# Altium schematic sheet a0206-2006.7.SchDoc
size 558 x 431 mm
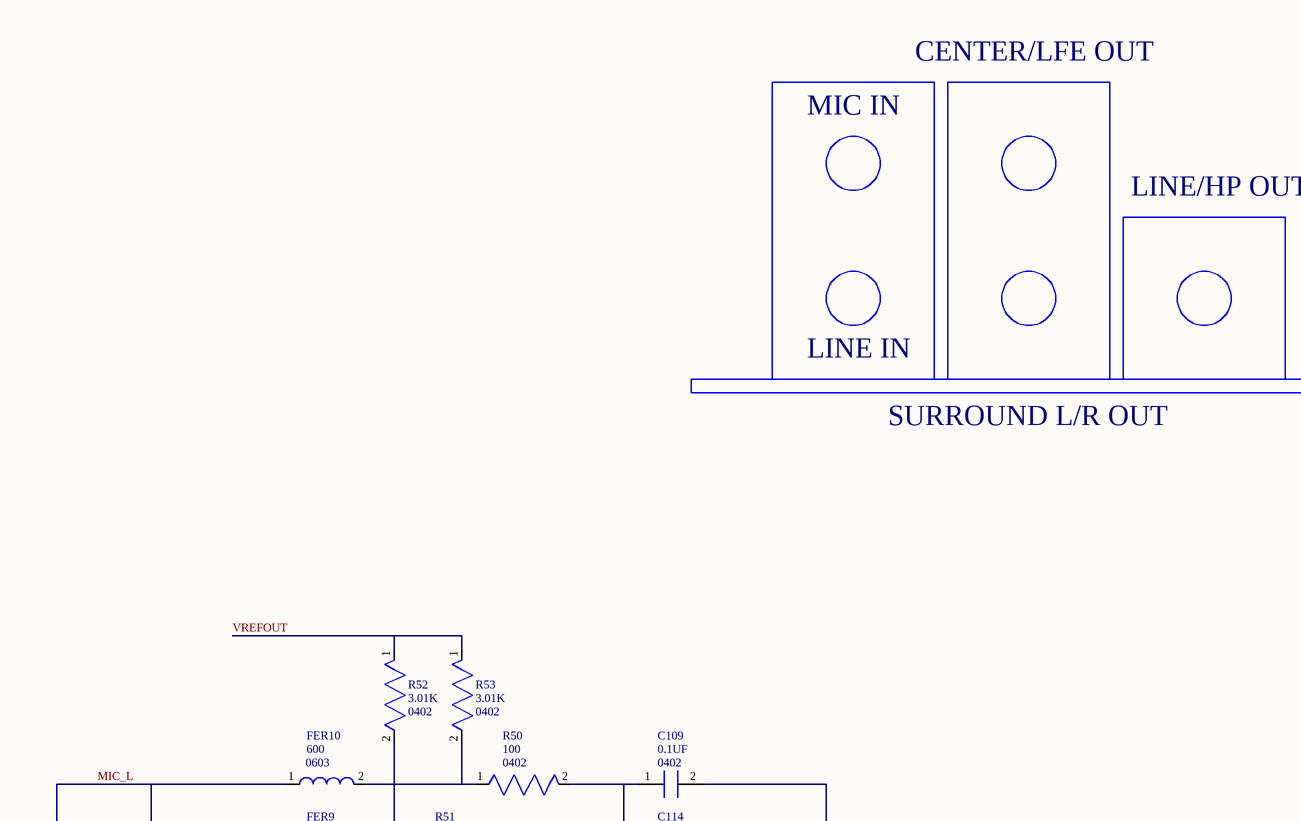
[diagram p0: a0206-2006.7.SchDoc, top left]
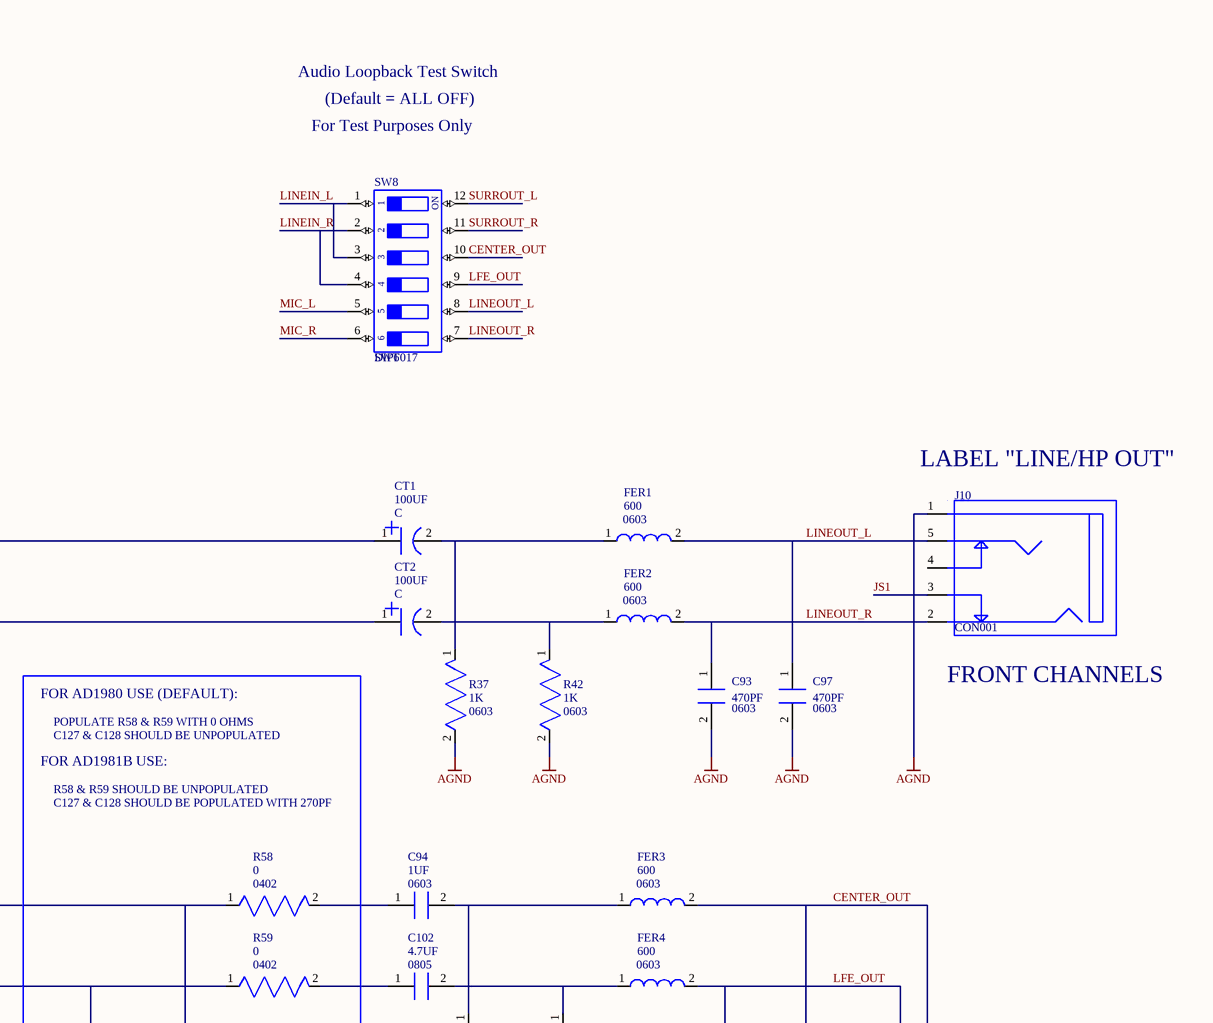
[diagram p1: a0206-2006.7.SchDoc, top right]
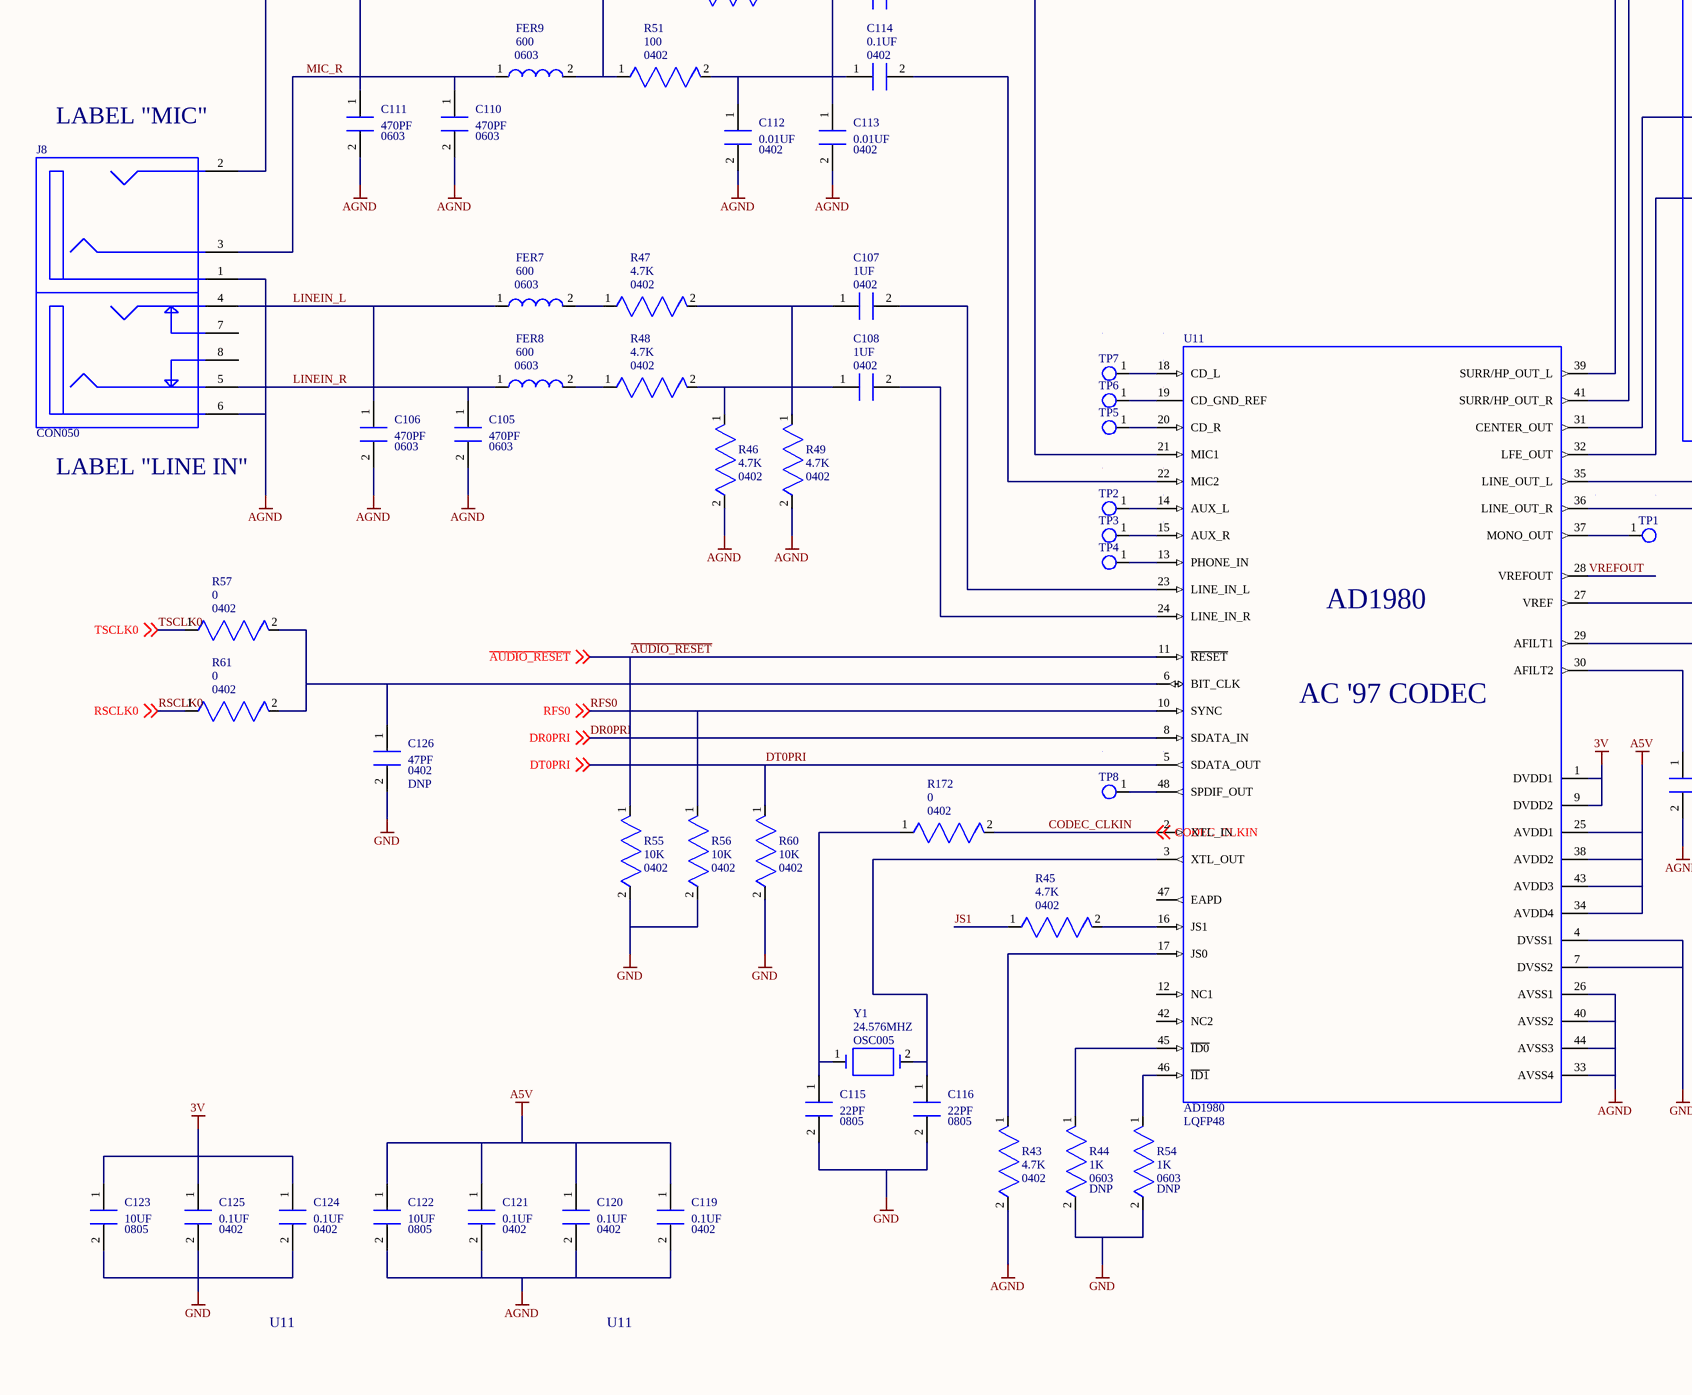
[diagram p2: a0206-2006.7.SchDoc, bottom left]
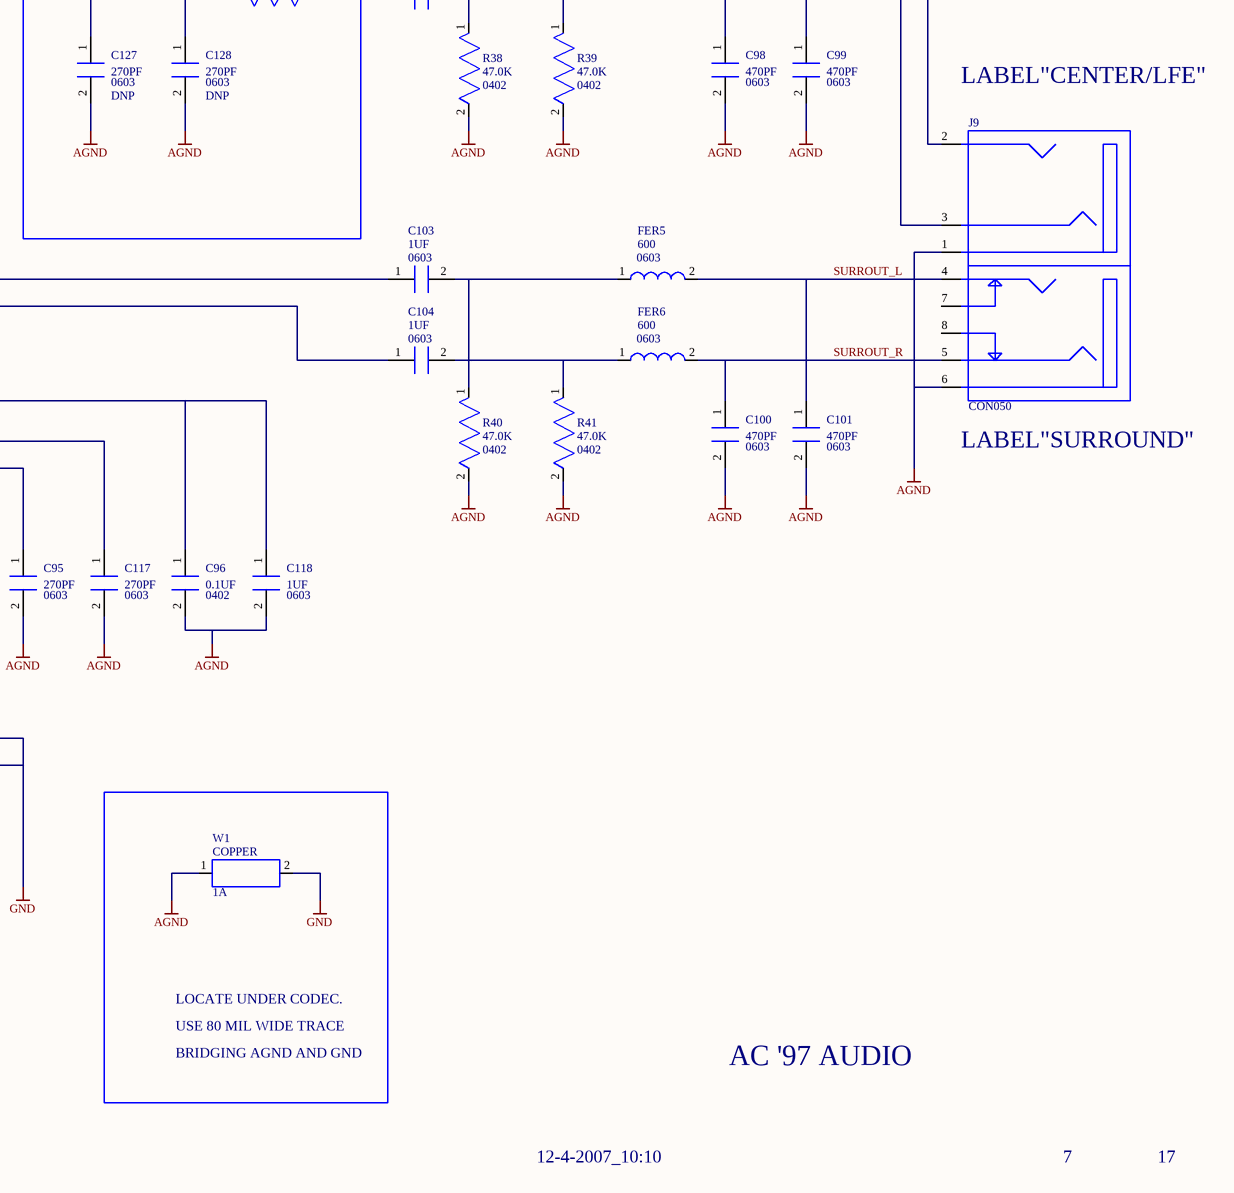
[diagram p3: a0206-2006.7.SchDoc, bottom right]

## Parts
C93  value 470PF  [0603]  (hidden comment: *)
C94  value 1UF  [0603]  (hidden comment: *)
C95  value 270PF  [0603]  (hidden comment: *)
C96  value 0.1UF  [0402]  (hidden comment: *)
C97  value 470PF  [0603]  (hidden comment: *)
C98  value 470PF  [0603]  (hidden comment: *)
C99  value 470PF  [0603]  (hidden comment: *)
C100  value 470PF  [0603]  (hidden comment: *)
C101  value 470PF  [0603]  (hidden comment: *)
C102  value 4.7UF  [0805]  (hidden comment: *)
C103  value 1UF  [0603]  (hidden comment: *)
C104  value 1UF  [0603]  (hidden comment: *)
C105  value 470PF  [0603]  (hidden comment: *)
C106  value 470PF  [0603]  (hidden comment: *)
C107  value 1UF  [0402]  (hidden comment: *)
C108  value 1UF  [0402]  (hidden comment: *)
C109  value 0.1UF  [0402]  (hidden comment: *)
C110  value 470PF  [0603]  (hidden comment: *)
C111  value 470PF  [0603]  (hidden comment: *)
C112  value 0.01UF  [0402]  (hidden comment: *)
C113  value 0.01UF  [0402]  (hidden comment: *)
C114  value 0.1UF  [0402]  (hidden comment: *)
C115  value 22PF  [0805]  (hidden comment: *)
C116  value 22PF  [0805]  (hidden comment: *)
C117  value 270PF  [0603]  (hidden comment: *)
C118  value 1UF  [0603]  (hidden comment: *)
C119  value 0.1UF  [0402]  (hidden comment: *)
C120  value 0.1UF  [0402]  (hidden comment: *)
C121  value 0.1UF  [0402]  (hidden comment: *)
C122  value 10UF  [0805]  (hidden comment: *)
C123  value 10UF  [0805]  (hidden comment: *)
C124  value 0.1UF  [0402]  (hidden comment: *)
C125  value 0.1UF  [0402]  (hidden comment: *)
C126  value 47PF  CLASS: DNP  [0402]  (hidden comment: *)
C127  value 270PF  CLASS: DNP  [0603]  (hidden comment: *)
C128  value 270PF  CLASS: DNP  [0603]  (hidden comment: *)
CT1  value 100UF  [C]  (hidden comment: *)
CT2  value 100UF  [C]  (hidden comment: *)
FER1  value 600  [0603]  (hidden comment: *)
FER2  value 600  [0603]  (hidden comment: *)
FER3  value 600  [0603]  (hidden comment: *)
FER4  value 600  [0603]  (hidden comment: *)
FER5  value 600  [0603]  (hidden comment: *)
FER6  value 600  [0603]  (hidden comment: *)
FER7  value 600  [0603]  (hidden comment: *)
FER8  value 600  [0603]  (hidden comment: *)
FER9  value 600  [0603]  (hidden comment: *)
FER10  value 600  [0603]  (hidden comment: *)
J8  *  [CON050]  (value not drawn)
J9  *  [CON050]  (value not drawn)
J10  *  [CON001]  (value not drawn)
R37  value 1K  [0603]  (hidden comment: *)
R38  value 47.0K  [0402]  (hidden comment: *)
R39  value 47.0K  [0402]  (hidden comment: *)
R40  value 47.0K  [0402]  (hidden comment: *)
R41  value 47.0K  [0402]  (hidden comment: *)
R42  value 1K  [0603]  (hidden comment: *)
R43  value 4.7K  [0402]  (hidden comment: *)
R44  value 1K  CLASS: DNP  [0603]  (hidden comment: *)
R45  value 4.7K  [0402]  (hidden comment: *)
R46  value 4.7K  [0402]  (hidden comment: *)
R47  value 4.7K  [0402]  (hidden comment: *)
R48  value 4.7K  [0402]  (hidden comment: *)
R49  value 4.7K  [0402]  (hidden comment: *)
R50  value 100  [0402]  (hidden comment: *)
R51  value 100  [0402]  (hidden comment: *)
R52  value 3.01K  [0402]  (hidden comment: *)
R53  value 3.01K  [0402]  (hidden comment: *)
R54  value 1K  CLASS: DNP  [0603]  (hidden comment: *)
R55  value 10K  [0402]  (hidden comment: *)
R56  value 10K  [0402]  (hidden comment: *)
R57  value 0  [0402]  (hidden comment: *)
R58  value 0  [0402]  (hidden comment: *)
R59  value 0  [0402]  (hidden comment: *)
R60  value 10K  [0402]  (hidden comment: *)
R61  value 0  [0402]  (hidden comment: *)
R172  value 0  [0402]  (hidden comment: *)
SW8  value DIP6  [SWT017]  (hidden comment: *)
TP1  *  [TP]  (value not drawn)
TP2  *  [TP]  (value not drawn)
TP3  *  [TP]  (value not drawn)
TP4  *  [TP]  (value not drawn)
TP5  *  [TP]  (value not drawn)
TP6  *  [TP]  (value not drawn)
TP7  *  [TP]  (value not drawn)
TP8  *  [TP]  (value not drawn)
U11  PART: AD1980  [LQFP48]  (hidden comment: *)
W1  value COPPER  [1A]  (hidden comment: *)
Y1  value 24.576MHZ  [OSC005]  (hidden comment: *)

## Nets
3V: C123.1(A) C124.1(A) C125.1(A) U11.1(DVDD1) U11.9(DVDD2)
A5V: C119.1(A) C120.1(A) C121.1(A) C122.1(A) U11.25(AVDD1) U11.34(AVDD4) U11.38(AVDD2) U11.43(AVDD3)
AGND: C93.2(B) C95.2(B) C96.2(B) C97.2(B) C98.2(B) C99.2(B) C100.2(B) C101.2(B) C105.2(B) C106.2(B) C110.2(B) C111.2(B) C112.2(B) C113.2(B) C117.2(B) C118.2(B) C119.2(B) C120.2(B) C121.2(B) C122.2(B) C127.2(B) C128.2(B) J8.1 J8.6 J9.1 J9.6 J10.1 R37.2(N2) R38.2(N2) R39.2(N2) R40.2(N2) R41.2(N2) R42.2(N2) R43.2(N2) R46.2(N2) R49.2(N2) U11.26(AVSS1) U11.33(AVSS4) U11.40(AVSS2) U11.44(AVSS3) W1.1(N1)
GND: C115.2(B) C116.2(B) C123.2(B) C124.2(B) C125.2(B) C126.2(B) R44.2(N2) R54.2(N2) R55.2(N2) R56.2(N2) R60.2(N2) U11.4(DVSS1) U11.7(DVSS2) W1.2(N2)
~{AUDIO_RESET}: R55.1(N1) U11.11(~{RESET}) ; off-sheet ~{AUDIO_RESET}
CENTER_OUT: C99.1(A) FER3.2(B) J9.2 SW8.10
CODEC_CLKIN: R172.2(N2) U11.2(XTL_IN) ; off-sheet CODEC_CLKIN
DR0PRI: U11.8(SDATA_IN) ; off-sheet DR0PRI
DT0PRI: R60.1(N1) U11.5(SDATA_OUT) ; off-sheet DT0PRI
JS1: J10.3 R45.1(N1)
LFE_OUT: C98.1(A) FER4.2(B) J9.3 SW8.9
LINEIN_L: C106.1(A) FER7.1(A) J8.4 SW8.1 SW8.3
LINEIN_R: C105.1(A) FER8.1(A) J8.5 SW8.2 SW8.4
LINEOUT_L: C97.1(A) FER1.2(B) J10.5 SW8.8
LINEOUT_R: C93.1(A) FER2.2(B) J10.2 SW8.7
MIC_L: C111.1(A) FER10.1(A) J8.2 SW8.5
MIC_R: C110.1(A) FER9.1(A) J8.3 SW8.6
RFS0: R56.1(N1) U11.10(SYNC) ; off-sheet RFS0
RSCLK0: R61.1(N1) ; off-sheet RSCLK0
SURROUT_L: C101.1(A) FER5.2(B) J9.4 SW8.12
SURROUT_R: C100.1(A) FER6.2(B) J9.5 SW8.11
TSCLK0: R57.1(N1) ; off-sheet TSCLK0
VREFOUT: R52.1(N1) R53.1(N1) U11.28(VREFOUT)
NetC94_1: C94.1(A) R58.2(N2)
NetC94_2: C94.2(B) FER3.1(A) R38.1(N1)
NetC95_1: C95.1(A) U11.30(AFILT2)
NetC96_1: C96.1(A) C118.1(A) U11.27(VREF)
NetC102_1: C102.1(A) R59.2(N2)
NetC102_2: C102.2(B) FER4.1(A) R39.1(N1)
NetC103_1: C103.1(A) U11.35(LINE_OUT_L)
NetC103_2: C103.2(B) FER5.1(A) R40.1(N1)
NetC104_1: C104.1(A) U11.36(LINE_OUT_R)
NetC104_2: C104.2(B) FER6.1(A) R41.1(N1)
NetC107_1: C107.1(A) R47.2(N2) R49.1(N1)
NetC107_2: C107.2(B) U11.23(LINE_IN_L)
NetC108_1: C108.1(A) R46.1(N1) R48.2(N2)
NetC108_2: C108.2(B) U11.24(LINE_IN_R)
NetC109_1: C109.1(A) C113.1(A) R50.2(N2)
NetC109_2: C109.2(B) U11.21(MIC1)
NetC112_1: C112.1(A) C114.1(A) R51.2(N2)
NetC114_2: C114.2(B) U11.22(MIC2)
NetC115_1: C115.1(A) R172.1(N1) Y1.1(N1)
NetC116_1: C116.1(A) U11.3(XTL_OUT) Y1.2(N2)
NetC117_1: C117.1(A) U11.29(AFILT1)
NetC126_1: C126.1(A) R57.2(N2) R61.2(N2) U11.6(BIT_CLK)
NetC127_1: C127.1(A) R59.1(N1) U11.32(LFE_OUT)
NetC128_1: C128.1(A) R58.1(N1) U11.31(CENTER_OUT)
NetCT1_1: CT1.1(P) U11.39(SURR/HP_OUT_L)
NetCT1_2: CT1.2(N) FER1.1(A) R37.1(N1)
NetCT2_1: CT2.1(P) U11.41(SURR/HP_OUT_R)
NetCT2_2: CT2.2(N) FER2.1(A) R42.1(N1)
NetFER7_2: FER7.2(B) R47.1(N1)
NetFER8_2: FER8.2(B) R48.1(N1)
NetFER9_2: FER9.2(B) R51.1(N1) R52.2(N2)
NetFER10_2: FER10.2(B) R50.1(N1) R53.2(N2)
NetR43_1: R43.1(N1) U11.17(JS0)
NetR44_1: R44.1(N1) U11.45(~{ID0})
NetR45_2: R45.2(N2) U11.16(JS1)
NetR54_1: R54.1(N1) U11.46(~{ID1})
NetTP1_1: TP1.1(TP) U11.37(MONO_OUT)
NetTP2_1: TP2.1(TP) U11.14(AUX_L)
NetTP3_1: TP3.1(TP) U11.15(AUX_R)
NetTP4_1: TP4.1(TP) U11.13(PHONE_IN)
NetTP5_1: TP5.1(TP) U11.20(CD_R)
NetTP6_1: TP6.1(TP) U11.19(CD_GND_REF)
NetTP7_1: TP7.1(TP) U11.18(CD_L)
NetTP8_1: TP8.1(TP) U11.48(SPDIF_OUT)

Not connected (* = marked no-connect by the designer): J8 7 8; J9 7 8; J10 4; U11 12(NC1) 42(NC2) 47(EAPD)

## Notes on the sheet
- CENTER/LFE OUT
- Audio Loopback Test Switch
- MIC IN
- For Test Purposes Only
- (Default = ALL OFF)
- LINE/HP OUT
- LINE IN
- SURROUND L/R OUT
- (near J10) LABEL "LINE/HP OUT"
- (near J10) FRONT CHANNELS
- FOR AD1980 USE (DEFAULT):
- POPULATE R58 & R59 WITH 0 OHMS
- C127 & C128 SHOULD BE UNPOPULATED
- FOR AD1981B USE:
- R58 & R59 SHOULD BE UNPOPULATED
- C127 & C128 SHOULD BE POPULATED WITH 270PF
- (near J8) LABEL "MIC"
- LABEL"CENTER/LFE"
- (near J8) LABEL "LINE IN"
- (near J9) LABEL"SURROUND"
- LOCATE UNDER CODEC.
- USE 80 MIL WIDE TRACE
- BRIDGING AGND AND GND
- AC '97 AUDIO
- U11
- 12-4-2007_10:10
- 7
- 17
- A
- B
- C
- D
- 1
- 2
- 3
- 20 Cotton Road
- 4
- DEVICES
- ANALOG
- Nashua, NH 03063
- PH: 1-800-ANALOGD
- Title
- ADSP-BF548 EZ-KIT LITE
- Size
- Board No.
- A0206-2006
- Rev
- 1.4B
- Date
- Sheet
- of
- (in symbol ICS_AD1980.1) AC '97 CODEC
- (in symbol SW_DIP6.1) ON

## Library data of the parts
C93 C99 C101 C106 C110 = CAP_NON_POLARIZED.2: PART_SPEC: CAPACITOR; LEVEL: STD; PRT_NUM: 7000352; TYPE: NPO; VOLTAGE: 50V; TOLERANCE: 5%; PKG_TYPE: 0603; ROHS: ROHS
C94 C103 = CAP_NON_POLARIZED.1: PART_SPEC: CAPACITOR; LEVEL: STD; PRT_NUM: 7000344; TYPE: X5R; VOLTAGE: 16V; TOLERANCE: 10%; PKG_TYPE: 0603; ROHS: ROHS
C95 C128 = CAP_NON_POLARIZED.2: PART_SPEC: CAPACITOR; LEVEL: STD; PRT_NUM: 7000419; TYPE: CERM; VOLTAGE: 50V; TOLERANCE: 5%; PKG_TYPE: 0603; ROHS: ROHS
C96 C120 = CAP_NON_POLARIZED.2: PART_SPEC: CAPACITOR; LEVEL: STD; PRT_NUM: 7000278; TYPE: X5R; VOLTAGE: 10V; TOLERANCE: 10%; PKG_TYPE: 0402; ROHS: ROHS
C97 C98 C100 C105 C111 = CAP_NON_POLARIZED.2: PART_SPEC: CAPACITOR; LEVEL: STD; TOLERANCE: 5%; VOLTAGE: 50V; TYPE: NPO; PRT_NUM: 7000352; PKG_TYPE: 0603; ROHS: ROHS
C102 = CAP_NON_POLARIZED.1: PART_SPEC: CAPACITOR; LEVEL: STD; TOLERANCE: 20%; VOLTAGE: 25V; TYPE: X5R; PRT_NUM: 7000347; PKG_TYPE: 0805; ROHS: ROHS
C104 = CAP_NON_POLARIZED.1: PART_SPEC: CAPACITOR; LEVEL: STD; TOLERANCE: 10%; VOLTAGE: 16V; TYPE: X5R; PRT_NUM: 7000344; PKG_TYPE: 0603; ROHS: ROHS
C107 = CAP_NON_POLARIZED.1: PART_SPEC: CAPACITOR; LEVEL: STD; TOLERANCE: 20%; VOLTAGE: 6.3V; TYPE: X7R; PRT_NUM: 7000431; PKG_TYPE: 0402; ROHS: ROHS
C108 = CAP_NON_POLARIZED.1: PART_SPEC: CAPACITOR; LEVEL: STD; PRT_NUM: 7000431; TYPE: X7R; VOLTAGE: 6.3V; TOLERANCE: 20%; PKG_TYPE: 0402; ROHS: ROHS
C109 = CAP_NON_POLARIZED.1: PART_SPEC: CAPACITOR; LEVEL: STD; PRT_NUM: 7000278; TYPE: X5R; VOLTAGE: 10V; TOLERANCE: 10%; PKG_TYPE: 0402; ROHS: ROHS
C112 = CAP_NON_POLARIZED.2: PART_SPEC: CAPACITOR; LEVEL: STD; TOLERANCE: 10%; VOLTAGE: 16V; TYPE: X7R; PRT_NUM: 7000279; PKG_TYPE: 0402; ROHS: ROHS
C113 = CAP_NON_POLARIZED.2: PART_SPEC: CAPACITOR; LEVEL: STD; PRT_NUM: 7000279; TYPE: X7R; VOLTAGE: 16V; TOLERANCE: 10%; PKG_TYPE: 0402; ROHS: ROHS
C114 = CAP_NON_POLARIZED.1: PART_SPEC: CAPACITOR; LEVEL: STD; TOLERANCE: 10%; VOLTAGE: 10V; TYPE: X5R; PRT_NUM: 7000278; PKG_TYPE: 0402; ROHS: ROHS
C115 = CAP_NON_POLARIZED.2: PART_SPEC: CAPACITOR; LEVEL: STD; PRT_NUM: 7000028; TYPE: NPO; VOLTAGE: 50V; TOLERANCE: 5%; PKG_TYPE: 0805; ROHS: ROHS
C116 = CAP_NON_POLARIZED.2: PART_SPEC: CAPACITOR; LEVEL: STD; TOLERANCE: 5%; VOLTAGE: 50V; TYPE: NPO; PRT_NUM: 7000028; PKG_TYPE: 0805; ROHS: ROHS
C117 C127 = CAP_NON_POLARIZED.2: PART_SPEC: CAPACITOR; LEVEL: STD; TOLERANCE: 5%; VOLTAGE: 50V; TYPE: CERM; PRT_NUM: 7000419; PKG_TYPE: 0603; ROHS: ROHS
C118 = CAP_NON_POLARIZED.2: PART_SPEC: CAPACITOR; LEVEL: STD; TOLERANCE: 10%; VOLTAGE: 16V; TYPE: X5R; PRT_NUM: 7000344; PKG_TYPE: 0603; ROHS: ROHS
C119 C121 C124 C125 = CAP_NON_POLARIZED.2: PART_SPEC: CAPACITOR; LEVEL: STD; TOLERANCE: 10%; VOLTAGE: 10V; TYPE: X5R; PRT_NUM: 7000278; PKG_TYPE: 0402; ROHS: ROHS
C122 C123 = CAP_NON_POLARIZED.2: PART_SPEC: CAPACITOR; LEVEL: STD; PRT_NUM: 7000265; TYPE: X5R; VOLTAGE: 6.3V; TOLERANCE: 10%; PKG_TYPE: 0805; ROHS: ROHS
C126 = CAP_NON_POLARIZED.2: PART_SPEC: CAPACITOR; LEVEL: STD; TOLERANCE: 10%; VOLTAGE: 10V; TYPE: X5R; PKG_TYPE: 0402; ROHS: ROHS
CT1 CT2 = CAP_POLARIZED.1: PART_SPEC: CAPACITOR; LEVEL: STD; PRT_NUM: 7000303; VOLTAGE: 10V; TOLERANCE: 10%; PKG_TYPE: C; TYPE: TANT-LOW-ESR; ROHS: ROHS
FER1 FER3 FER5 FER8 FER10 = FER_STANDARD.1: PART_SPEC: FERRITE; LEVEL: STD; PRT_NUM: 7000112; FREQ: 100MHZ; CURRENT: 200MA; PKG_TYPE: 0603; ROHS: ROHS
FER2 FER4 FER6 FER7 FER9 = FER_STANDARD.1: PART_SPEC: FERRITE; LEVEL: STD; CURRENT: 200MA; FREQ: 100MHZ; PRT_NUM: 7000112; PKG_TYPE: 0603; ROHS: ROHS
J8 = CON_STEREOJACK_DUAL.2: AUDIO; PART_SPEC: CONNECTOR; LEVEL: STD; PRT_NUM: 6000825; CONFIGURATION: DUAL_STEREO; PKG_TYPE: CON050; TYPE: 3.5MM; ROHS: ROHS
J9 = CON_STEREOJACK_DUAL.1: AUDIO; PART_SPEC: CONNECTOR; LEVEL: STD; PRT_NUM: 6000825; CONFIGURATION: DUAL_STEREO; PKG_TYPE: CON050; TYPE: 3.5MM; ROHS: ROHS
J10 = CON_STEREOJACK.3: REPLACES ST-323-5; PART_SPEC: CONNECTOR; LEVEL: STD; PRT_NUM: 6000798; CONFIGURATION: STEREO_JACK; PKG_TYPE: CON001; TYPE: 3.5MM; ROHS: ROHS
R37 R44 = RES_STANDARD.2: PART_SPEC: RESISTOR; LEVEL: STD; PRT_NUM: 7000384; POWER: 1/10W; TOLERANCE: 5%; PKG_TYPE: 0603; ROHS: ROHS
R38-R41 = RES_STANDARD.2: PART_SPEC: RESISTOR; LEVEL: STD; PRT_NUM: 7000567; POWER: 1/16W; TOLERANCE: 1%; PKG_TYPE: 0402; ROHS: ROHS
R42 R54 = RES_STANDARD.2: PART_SPEC: RESISTOR; LEVEL: STD; TOLERANCE: 5%; POWER: 1/10W; PRT_NUM: 7000384; PKG_TYPE: 0603; ROHS: ROHS
R43 R49 = RES_STANDARD.2: PART_SPEC: RESISTOR; LEVEL: STD; TOLERANCE: 5%; POWER: 1/16W; PRT_NUM: 7000281; PKG_TYPE: 0402; ROHS: ROHS
R45 R47 = RES_STANDARD.1: PART_SPEC: RESISTOR; LEVEL: STD; PRT_NUM: 7000281; POWER: 1/16W; TOLERANCE: 5%; PKG_TYPE: 0402; ROHS: ROHS
R46 = RES_STANDARD.2: PART_SPEC: RESISTOR; LEVEL: STD; PRT_NUM: 7000281; POWER: 1/16W; TOLERANCE: 5%; PKG_TYPE: 0402; ROHS: ROHS
R48 = RES_STANDARD.1: PART_SPEC: RESISTOR; LEVEL: STD; TOLERANCE: 5%; POWER: 1/16W; PRT_NUM: 7000281; PKG_TYPE: 0402; ROHS: ROHS
R50 = RES_STANDARD.1: PART_SPEC: RESISTOR; LEVEL: STD; TOLERANCE: 5%; POWER: 1/16W; PRT_NUM: 7000432; PKG_TYPE: 0402; ROHS: ROHS
R51 = RES_STANDARD.1: PART_SPEC: RESISTOR; LEVEL: STD; PRT_NUM: 7000432; POWER: 1/16W; TOLERANCE: 5%; PKG_TYPE: 0402; ROHS: ROHS
R52 = RES_STANDARD.2: PART_SPEC: RESISTOR; LEVEL: STD; PRT_NUM: 7000568; POWER: 1/16W; TOLERANCE: 1%; PKG_TYPE: 0402; ROHS: ROHS
R53 = RES_STANDARD.2: PART_SPEC: RESISTOR; LEVEL: STD; TOLERANCE: 1%; POWER: 1/16W; PRT_NUM: 7000568; PKG_TYPE: 0402; ROHS: ROHS
R55 R60 = RES_STANDARD.2: PART_SPEC: RESISTOR; LEVEL: STD; TOLERANCE: 5%; POWER: 1/16W; PRT_NUM: 7000280; PKG_TYPE: 0402; ROHS: ROHS
R56 = RES_STANDARD.2: PART_SPEC: RESISTOR; LEVEL: STD; PRT_NUM: 7000280; POWER: 1/16W; TOLERANCE: 5%; PKG_TYPE: 0402; ROHS: ROHS
R57 = RES_STANDARD.1: PART_SPEC: RESISTOR; LEVEL: STD; PRT_NUM: 7000282; TOLERANCE: 5%; POWER: 1/16W; PKG_TYPE: 0402; ROHS: ROHS
R58 R61 R172 = RES_STANDARD.1: PART_SPEC: RESISTOR; LEVEL: STD; PRT_NUM: 7000282; POWER: 1/16W; TOLERANCE: 5%; PKG_TYPE: 0402; ROHS: ROHS
R59 = RES_STANDARD.1: PART_SPEC: RESISTOR; LEVEL: STD; TOLERANCE: 5%; POWER: 1/16W; PRT_NUM: 7000282; PKG_TYPE: 0402; ROHS: ROHS
SW8 = SW_DIP6.1: PART_SPEC: SWITCH; LEVEL: STD; PRT_NUM: 6000131; PKG_TYPE: SWT017; ROHS: ROHS
TP1-TP8 = MSC_TEST_POINT.2: TESTPOINT; CLASS: DNP; LEVEL: STD; PART_SPEC: TESTPOINT; PART: TESTPOINT; ROHS: ROHS; PKG_TYPE: TP
U11 = ICS_AD1980.1: AC’97 CODEC; LEVEL: STD; PRT_NUM: 30-025762-01; PKG_TYPE: LQFP48; WEB: http://www.analog.com/en/prod/0%2C2877%2CAD1980%2C00.html; ROHS: ROHS
W1 = MSC_COPPER.1: LEVEL: STD; CLASS: DNP; PKG_TYPE: 1A
Y1 = OSC_CRYSTAL.1: CRYSTAL; LEVEL: STD; PRT_NUM: 1000118; PART_SPEC: CRYSTAL; PKG_TYPE: OSC005; ROHS: ROHS